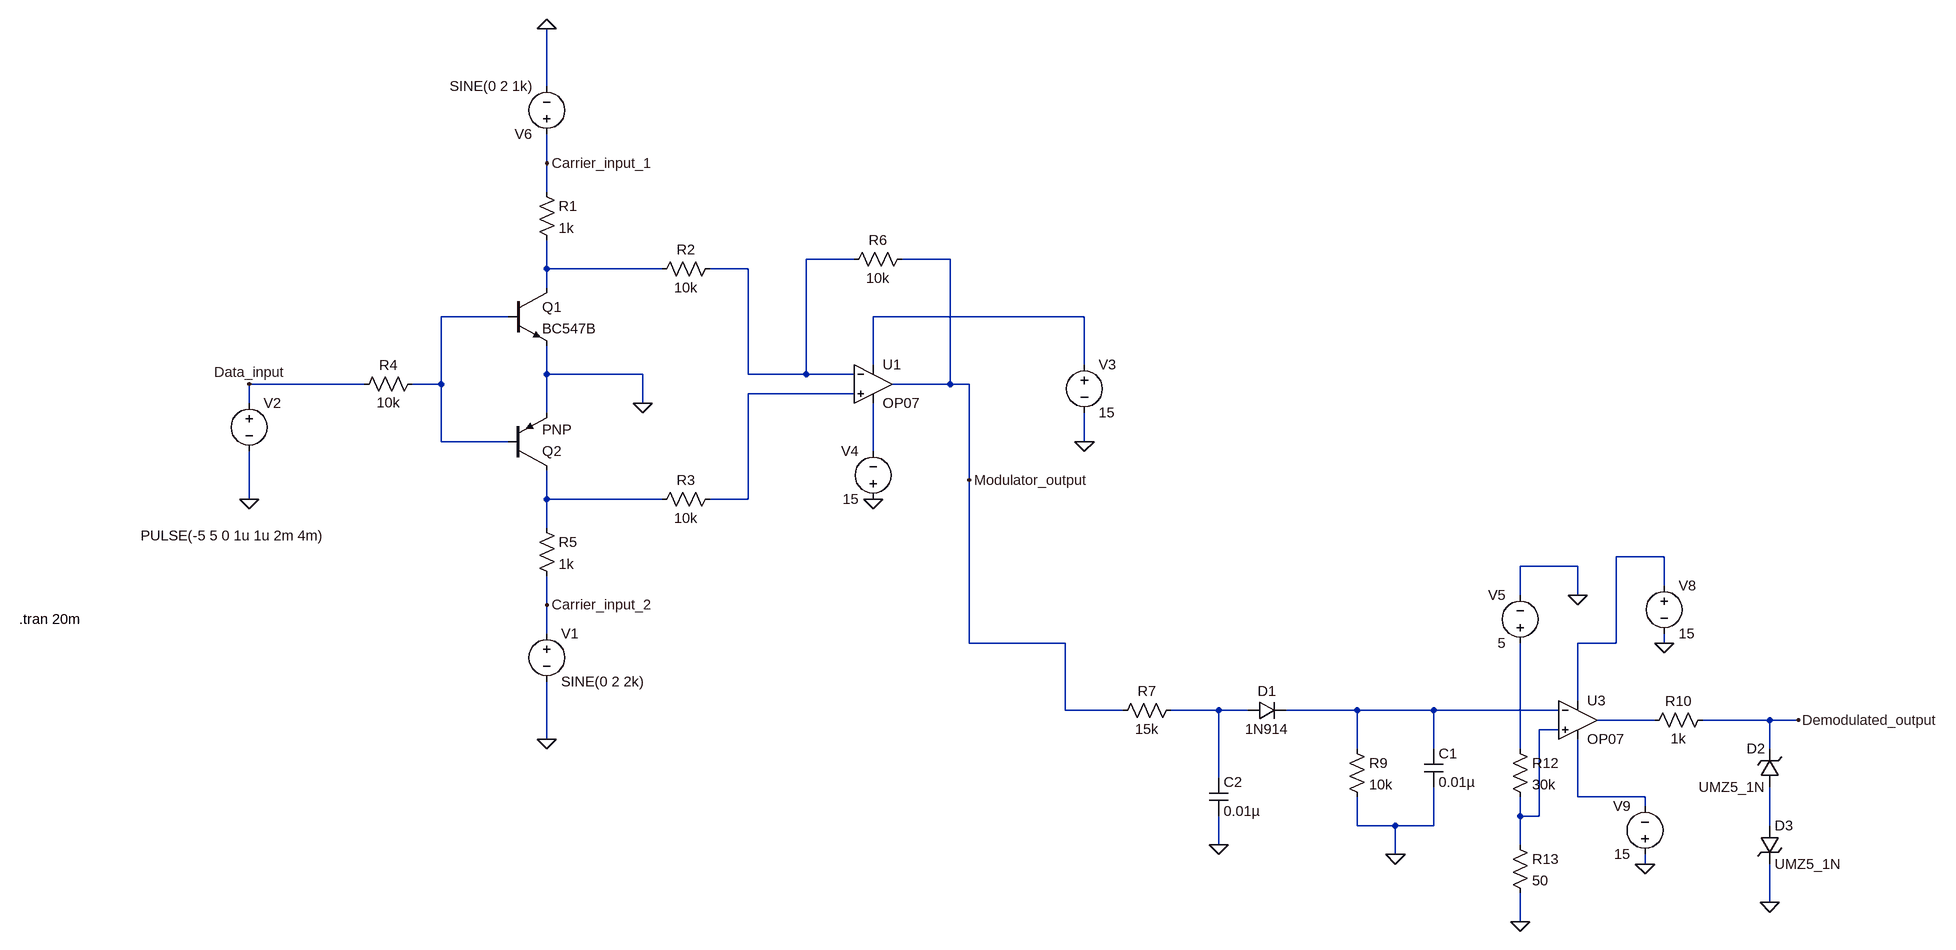
[diagram p0: schematic FSK modulation and demodulation.asc]
FSK modulation and demodulation.asc, the LTspice schematic file:
Version 4
SHEET 1 2852 1084
WIRE 272 -336 272 -432
WIRE 272 -208 272 -256
WIRE 272 -160 272 -208
WIRE 784 -48 704 -48
WIRE 944 -48 864 -48
WIRE 272 -32 272 -80
WIRE 464 -32 272 -32
WIRE 608 -32 544 -32
WIRE 272 0 272 -32
WIRE 208 48 96 48
WIRE 1168 48 816 48
WIRE 816 128 816 48
WIRE 1168 128 1168 48
WIRE 272 144 272 96
WIRE 432 144 272 144
WIRE 608 144 608 -32
WIRE 704 144 704 -48
WIRE 704 144 608 144
WIRE 784 144 704 144
WIRE -32 160 -224 160
WIRE 96 160 96 48
WIRE 96 160 48 160
WIRE 944 160 944 -48
WIRE 944 160 848 160
WIRE 976 160 944 160
WIRE 784 176 608 176
WIRE -224 192 -224 160
WIRE 432 192 432 144
WIRE 272 208 272 144
WIRE 96 256 96 160
WIRE 208 256 96 256
WIRE 1168 256 1168 208
WIRE 816 272 816 192
WIRE 976 320 976 160
WIRE -224 352 -224 272
WIRE 272 352 272 304
WIRE 464 352 272 352
WIRE 608 352 608 176
WIRE 608 352 544 352
WIRE 272 400 272 352
WIRE 2176 448 2096 448
WIRE 2032 464 1936 464
WIRE 2176 496 2176 448
WIRE 1936 512 1936 464
WIRE 2032 512 2032 464
WIRE 272 528 272 480
WIRE 272 576 272 528
WIRE 976 592 976 320
WIRE 1136 592 976 592
WIRE 2096 592 2096 448
WIRE 2096 592 2032 592
WIRE 2176 592 2176 576
WIRE 2032 688 2032 592
WIRE 1136 704 1136 592
WIRE 1232 704 1136 704
WIRE 1392 704 1312 704
WIRE 1440 704 1392 704
WIRE 1664 704 1504 704
WIRE 1792 704 1664 704
WIRE 2000 704 1792 704
WIRE 2160 720 2064 720
WIRE 2352 720 2240 720
WIRE 2400 720 2352 720
WIRE 2000 736 1968 736
WIRE 272 752 272 656
WIRE 1664 768 1664 704
WIRE 1792 768 1792 704
WIRE 1936 768 1936 592
WIRE 2352 768 2352 720
WIRE 1392 816 1392 704
WIRE 2032 848 2032 752
WIRE 2144 848 2032 848
WIRE 2144 864 2144 848
WIRE 1936 880 1936 848
WIRE 1968 880 1968 736
WIRE 1968 880 1936 880
WIRE 1664 896 1664 848
WIRE 1728 896 1664 896
WIRE 1792 896 1792 832
WIRE 1792 896 1728 896
WIRE 2352 896 2352 832
WIRE 1392 928 1392 880
WIRE 1936 928 1936 880
WIRE 1728 944 1728 896
WIRE 2144 960 2144 944
WIRE 2352 1024 2352 960
WIRE 1936 1056 1936 1008
FLAG -224 352 0
FLAG 272 752 0
FLAG 1168 256 0
FLAG 816 352 0
FLAG 432 192 0
FLAG 2352 1024 0
FLAG 1728 944 0
FLAG 2032 512 0
FLAG 1936 1056 0
FLAG 2176 592 0
FLAG 2144 960 0
FLAG 272 528 Carrier_input_2
FLAG -224 160 Data_input
FLAG 976 320 Modulator_output
FLAG 2400 720 Demodulated_output
FLAG 1392 928 0
FLAG 272 -432 0
FLAG 272 -208 Carrier_input_1
SYMBOL res 256 -176 R0
SYMATTR InstName R1
SYMATTR Value 1k
SYMBOL res 560 -48 R90
WINDOW 0 0 56 VBottom 2
WINDOW 3 32 56 VTop 2
SYMATTR InstName R2
SYMATTR Value 10k
SYMBOL res 560 336 R90
WINDOW 0 0 56 VBottom 2
WINDOW 3 32 56 VTop 2
SYMATTR InstName R3
SYMATTR Value 10k
SYMBOL res 64 144 R90
WINDOW 0 0 56 VBottom 2
WINDOW 3 32 56 VTop 2
SYMATTR InstName R4
SYMATTR Value 10k
SYMBOL res 256 384 R0
SYMATTR InstName R5
SYMATTR Value 1k
SYMBOL voltage 272 560 R0
WINDOW 123 0 0 Left 0
WINDOW 39 0 0 Left 0
SYMATTR InstName V1
SYMATTR Value SINE(0 2 2k)
SYMBOL voltage -224 176 R0
WINDOW 123 0 0 Left 0
WINDOW 39 0 0 Left 0
WINDOW 3 -181 237 Left 2
SYMATTR Value PULSE(-5 5 0 1u 1u 2m 4m)
SYMATTR InstName V2
SYMBOL res 880 -64 R90
WINDOW 0 0 56 VBottom 2
WINDOW 3 32 56 VTop 2
SYMATTR InstName R6
SYMATTR Value 10k
SYMBOL voltage 1168 112 R0
WINDOW 123 0 0 Left 0
WINDOW 39 0 0 Left 0
SYMATTR InstName V3
SYMATTR Value 15
SYMBOL voltage 816 368 R180
WINDOW 0 24 96 Left 2
WINDOW 3 24 16 Left 2
WINDOW 123 0 0 Left 0
WINDOW 39 0 0 Left 0
SYMATTR InstName V4
SYMATTR Value 15
SYMBOL res 1648 752 R0
SYMATTR InstName R9
SYMATTR Value 10k
SYMBOL cap 1776 768 R0
SYMATTR InstName C1
SYMATTR Value 0.01µ
SYMBOL OpAmps\\OP07 2032 656 R0
SYMATTR InstName U3
SYMBOL res 2144 736 R270
WINDOW 0 32 56 VTop 2
WINDOW 3 0 56 VBottom 2
SYMATTR InstName R10
SYMATTR Value 1k
SYMBOL res 1920 752 R0
SYMATTR InstName R12
SYMATTR Value 30k
SYMBOL res 1920 912 R0
SYMATTR InstName R13
SYMATTR Value 50
SYMBOL voltage 1936 608 R180
WINDOW 0 24 96 Left 2
WINDOW 3 24 16 Left 2
WINDOW 123 0 0 Left 0
WINDOW 39 0 0 Left 0
SYMATTR InstName V5
SYMATTR Value 5
SYMBOL voltage 2176 480 R0
WINDOW 123 0 0 Left 0
WINDOW 39 0 0 Left 0
SYMATTR InstName V8
SYMATTR Value 15
SYMBOL voltage 2144 960 R180
WINDOW 0 24 96 Left 2
WINDOW 3 24 16 Left 2
WINDOW 123 0 0 Left 0
WINDOW 39 0 0 Left 0
SYMATTR InstName V9
SYMATTR Value 15
SYMBOL npn 208 0 R0
SYMATTR InstName Q1
SYMATTR Value BC547B
SYMBOL pnp 208 304 M180
SYMATTR InstName Q2
SYMBOL res 1328 688 R90
WINDOW 0 0 56 VBottom 2
WINDOW 3 32 56 VTop 2
SYMATTR InstName R7
SYMATTR Value 15k
SYMBOL cap 1376 816 R0
SYMATTR InstName C2
SYMATTR Value 0.01µ
SYMBOL diode 1440 720 R270
WINDOW 0 32 32 VTop 2
WINDOW 3 0 32 VBottom 2
SYMATTR InstName D1
SYMATTR Value 1N914
SYMBOL voltage 272 -240 R180
WINDOW 123 0 0 Left 0
WINDOW 39 0 0 Left 0
SYMATTR InstName V6
SYMATTR Value SINE(0 2 1k)
SYMBOL zener 2368 832 R180
WINDOW 0 24 64 Left 2
WINDOW 3 24 0 Left 2
SYMATTR InstName D2
SYMATTR Value UMZ5_1N
SYMATTR Description Diode
SYMATTR Type diode
SYMBOL zener 2336 896 R0
SYMATTR InstName D3
SYMATTR Value UMZ5_1N
SYMATTR Description Diode
SYMATTR Type diode
SYMBOL OpAmps\\OP07 816 96 R0
SYMATTR InstName U1
TEXT -784 552 Left 2 !.tran 20m

The netlist it stands for:
* FSK modulation and demodulation.asc
R1 Carrier_input_1 N002 1k
R2 N001 N002 10k
R3 N005 N007 10k
R4 N003 Data_input 10k
R5 N007 Carrier_input_2 1k
V1 Carrier_input_2 0 SINE(0 2 2k)
V2 Data_input 0 PULSE(-5 5 0 1u 1u 2m 4m)
R6 Modulator_output N001 10k
V3 N004 0 15
V4 0 N006 15
R9 N010 0 10k
C1 N010 0 0.01µ
XU3 N012 N010 N008 N014 N011 LT1001  ; OP07, pins In+ In- V+ V- OUT
R10 N011 Demodulated_output 1k
R12 N013 N012 30k
R13 N012 0 50
V5 N013 0 5
V8 N008 0 15
V9 0 N014 15
Q1 N002 N003 0 0 BC547B
Q2 N007 N003 0 0 PNP
R7 N009 Modulator_output 15k
C2 N009 0 0.01µ
D1 N009 N010 1N914
V6 Carrier_input_1 0 SINE(0 2 1k)
D2 N015 Demodulated_output UMZ5_1N
D3 N015 0 UMZ5_1N
XU1 N005 N001 N004 N006 Modulator_output LT1001  ; OP07, pins In+ In- V+ V- OUT
.model D D
.lib standard.dio
.model NPN NPN
.model PNP PNP
.lib standard.bjt
.tran 20m
.lib LTC.lib
.backanno
.end